# Altium project Servo-Board-v1.0.PrjPcb (part 14 of 23)

## Sheet Servo1.SchDoc
size 420 x 297 mm; SheetNumber: 7; SheetTotal: 26
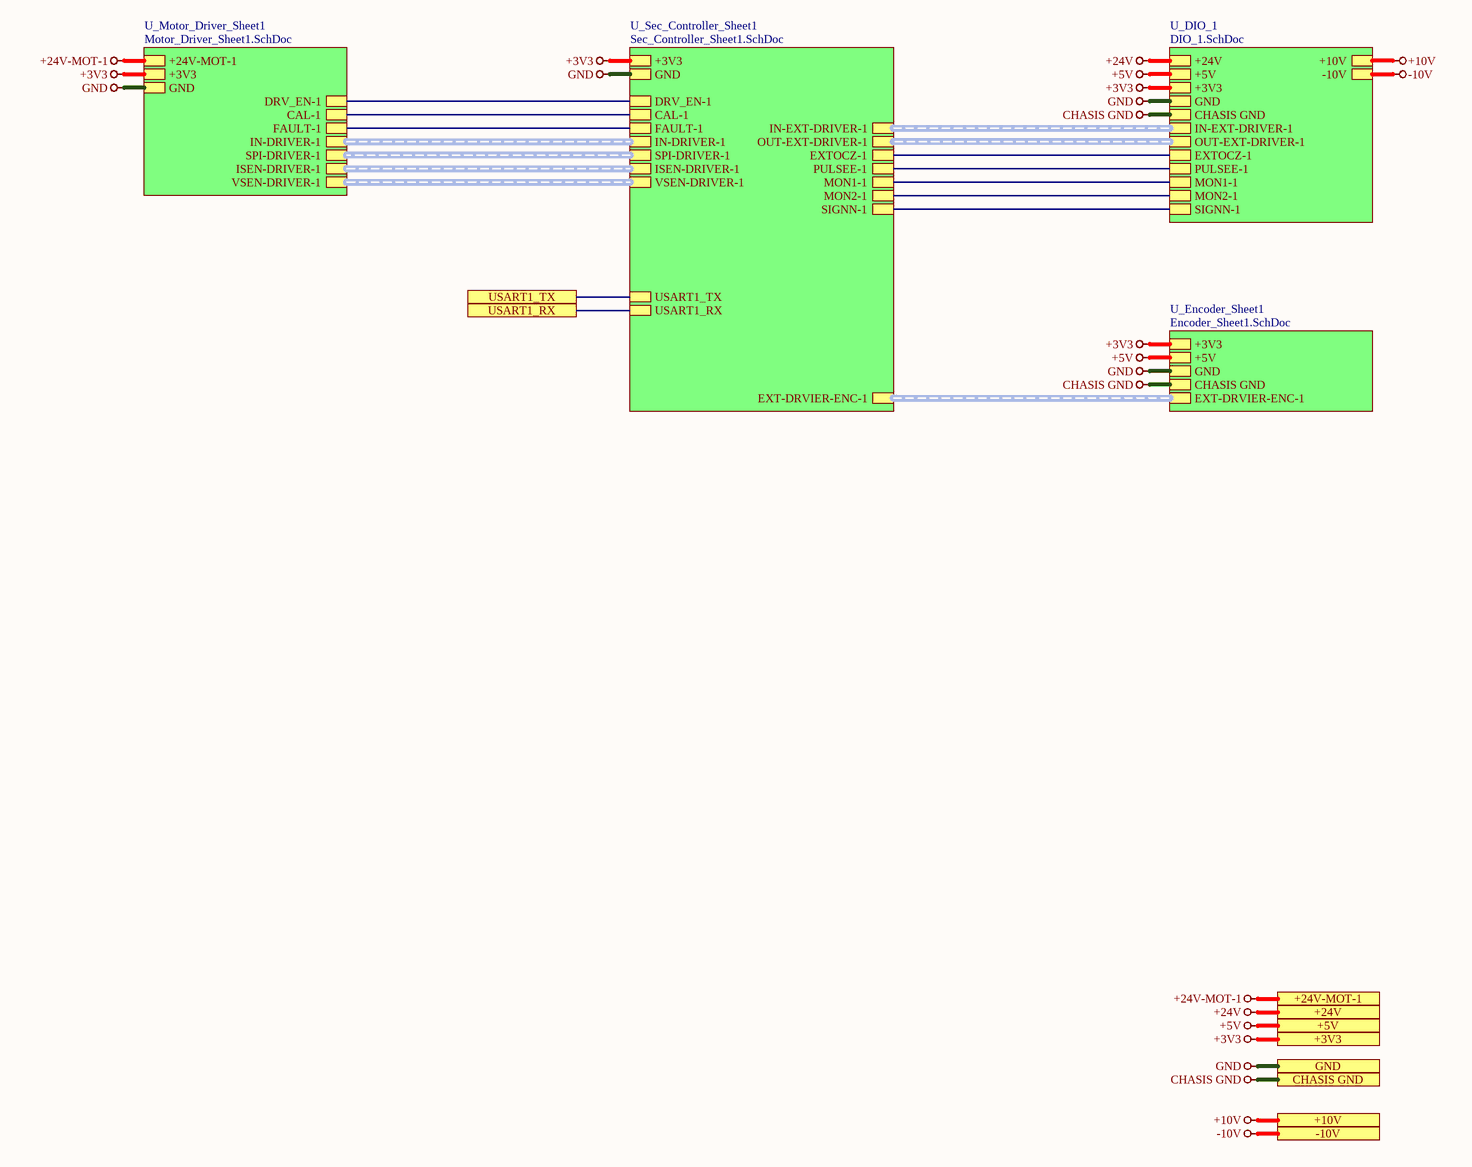
[diagram p16: Servo1.SchDoc]

### Sub-sheets
U_DIO_1 = DIO_1.SchDoc: +24V, +5V, GND, +3V3, CHASIS GND, IN-EXT-DRIVER-1 (harness IN-EXT-DRIVER-1), OUT-EXT-DRIVER-1 (harness OUT-EXT-DRIVER-1), EXTOCZ-1, PULSEE-1, MON1-1, MON2-1, SIGNN-1, +10V, -10V
U_Encoder_Sheet1 = Encoder_Sheet1.SchDoc: +3V3, +5V, GND, CHASIS GND, EXT-DRVIER-ENC-1 (harness EXT-DRVIER-ENC-1)
U_Motor_Driver_Sheet1 = Motor_Driver_Sheet1.SchDoc: +24V-MOT-1, +3V3, GND, IN-DRIVER-1 (harness IN-DRIVER-1), DRV_EN-1, CAL-1, FAULT-1, SPI-DRIVER-1 (harness SPI-DRIVER-1), ISEN-DRIVER-1 (harness ISEN-DRIVER-1), VSEN-DRIVER-1 (harness VSEN-DRIVER-1)
U_Sec_Controller_Sheet1 = Sec_Controller_Sheet1.SchDoc: +3V3, GND, IN-DRIVER-1 (harness IN-DRIVER-1), DRV_EN-1, CAL-1, FAULT-1, SPI-DRIVER-1 (harness SPI-DRIVER-1), ISEN-DRIVER-1 (harness ISEN-DRIVER-1), EXT-DRVIER-ENC-1 (harness EXT-DRVIER-ENC-1), IN-EXT-DRIVER-1 (harness IN-EXT-DRIVER-1), OUT-EXT-DRIVER-1 (harness OUT-EXT-DRIVER-1), EXTOCZ-1, PULSEE-1, MON1-1, MON2-1, SIGNN-1, USART1_TX, USART1_RX, VSEN-DRIVER-1 (harness VSEN-DRIVER-1)

### Ports
+3V3 (see Top_Sheet[5A], CAN_Sheet[4D], Controller_Sheet[5D], DIO_1[5D], DIO_2[5D], DIO_3[5D], DIO_4[5D], Encoder_Sheet1[5D], Encoder_Sheet2[4D], Encoder_Sheet3[4D], Encoder_Sheet4[5D], EtherCAT_Sheet[5D], Motor_Driver_Sheet1[5D], Motor_Driver_Sheet2[5D], Motor_Driver_Sheet3[5D], Motor_Driver_Sheet4[5D], Power_Sheet[5D], RS485_RS232_Sheet[5D], Sec_Controller_Sheet1[5D], Sec_Controller_Sheet2[5D], Sec_Controller_Sheet3[5D], Sec_Controller_Sheet4[5D], Servo2[5D], Servo3[5D], Servo4[5D]), +5V (see Top_Sheet[5A], CAN_Sheet[4D], Controller_Sheet[5D], DIO_1[5D], DIO_2[5D], DIO_3[5D], DIO_4[5D], Encoder_Sheet1[5D], Encoder_Sheet2[4D], Encoder_Sheet3[4D], Encoder_Sheet4[5D], Power_Sheet[5D], Servo2[5D], Servo3[5D], Servo4[5D]), +10V (see Top_Sheet[5A], DIO_1[5D], DIO_2[5D], DIO_3[5D], DIO_4[5D], Power_Sheet[5D], Servo2[5D], Servo3[5D], Servo4[5D]), +24V (see Top_Sheet[5A], DIO_1[5D], DIO_2[5D], DIO_3[5D], DIO_4[5D], Power_Sheet[5D], Servo2[5D], Servo3[5D], Servo4[5D]), +24V-MOT-1 (see Top_Sheet[5A], Motor_Driver_Sheet1[5D], Power_Sheet[5D]), -10V (see Top_Sheet[5A], DIO_1[5D], DIO_2[5D], DIO_3[5D], DIO_4[5D], Power_Sheet[5D], Servo2[5D], Servo3[5D], Servo4[5D]), CHASIS GND (see Top_Sheet[5A], DIO_1[5D], DIO_2[5D], DIO_3[5D], DIO_4[5D], Encoder_Sheet1[5D], Encoder_Sheet2[4D], Encoder_Sheet3[4D], Encoder_Sheet4[5D], EtherCAT_Sheet[5D], Power_Sheet[5D], Servo2[5D], Servo3[5D], Servo4[5D]), GND (see Top_Sheet[5A], CAN_Sheet[4D], Controller_Sheet[5D], DIO_1[5D], DIO_2[5D], DIO_3[5D], DIO_4[5D], Encoder_Sheet1[5D], Encoder_Sheet2[4D], Encoder_Sheet3[4D], Encoder_Sheet4[5D], EtherCAT_Sheet[5D], Motor_Driver_Sheet1[5D], Motor_Driver_Sheet2[5D], Motor_Driver_Sheet3[5D], Motor_Driver_Sheet4[5D], Power_Sheet[5D], RS485_RS232_Sheet[5D], Sec_Controller_Sheet1[5D], Sec_Controller_Sheet2[5D], Sec_Controller_Sheet3[5D], Sec_Controller_Sheet4[5D], Servo2[5D], Servo3[5D], Servo4[5D]), USART1_RX (see Top_Sheet[5A], Controller_Sheet[4D], Sec_Controller_Sheet1[5D]), USART1_TX (see Top_Sheet[5A], Controller_Sheet[4D], Sec_Controller_Sheet1[5D])

### Nets
+3V3: port +3V3, sheet U_Sec_Controller_Sheet1/+3V3, sheet U_Motor_Driver_Sheet1/+3V3, sheet U_Encoder_Sheet1/+3V3, sheet U_DIO_1/+3V3
+5V: port +5V, sheet U_Encoder_Sheet1/+5V, sheet U_DIO_1/+5V
+10V: port +10V, sheet U_DIO_1/+10V
+24V: port +24V, sheet U_DIO_1/+24V
+24V-MOT-1: port +24V-MOT-1, sheet U_Motor_Driver_Sheet1/+24V-MOT-1
-10V: port -10V, sheet U_DIO_1/-10V
CHASIS GND: port CHASIS GND, sheet U_Encoder_Sheet1/CHASIS GND, sheet U_DIO_1/CHASIS GND
GND: port GND, sheet U_Sec_Controller_Sheet1/GND, sheet U_Motor_Driver_Sheet1/GND, sheet U_Encoder_Sheet1/GND, sheet U_DIO_1/GND
CAL-1: sheet U_Sec_Controller_Sheet1/CAL-1, sheet U_Motor_Driver_Sheet1/CAL-1
DRV_EN-1: sheet U_Sec_Controller_Sheet1/DRV_EN-1, sheet U_Motor_Driver_Sheet1/DRV_EN-1
EXTOCZ-1: sheet U_Sec_Controller_Sheet1/EXTOCZ-1, sheet U_DIO_1/EXTOCZ-1
FAULT-1: sheet U_Sec_Controller_Sheet1/FAULT-1, sheet U_Motor_Driver_Sheet1/FAULT-1
MON1-1: sheet U_Sec_Controller_Sheet1/MON1-1, sheet U_DIO_1/MON1-1
MON2-1: sheet U_Sec_Controller_Sheet1/MON2-1, sheet U_DIO_1/MON2-1
PULSEE-1: sheet U_Sec_Controller_Sheet1/PULSEE-1, sheet U_DIO_1/PULSEE-1
SIGNN-1: sheet U_Sec_Controller_Sheet1/SIGNN-1, sheet U_DIO_1/SIGNN-1
USART1_RX: port USART1_RX, sheet U_Sec_Controller_Sheet1/USART1_RX
USART1_TX: port USART1_TX, sheet U_Sec_Controller_Sheet1/USART1_TX

### Buses and harness runs
harness sheet U_DIO_1/IN-EXT-DRIVER-1 = sheet U_Sec_Controller_Sheet1/IN-EXT-DRIVER-1
harness sheet U_DIO_1/OUT-EXT-DRIVER-1 = sheet U_Sec_Controller_Sheet1/OUT-EXT-DRIVER-1
harness sheet U_Encoder_Sheet1/EXT-DRVIER-ENC-1 = sheet U_Sec_Controller_Sheet1/EXT-DRVIER-ENC-1
harness sheet U_Motor_Driver_Sheet1/IN-DRIVER-1 = sheet U_Sec_Controller_Sheet1/IN-DRIVER-1
harness sheet U_Motor_Driver_Sheet1/ISEN-DRIVER-1 = sheet U_Sec_Controller_Sheet1/ISEN-DRIVER-1
harness sheet U_Motor_Driver_Sheet1/SPI-DRIVER-1 = sheet U_Sec_Controller_Sheet1/SPI-DRIVER-1
harness sheet U_Motor_Driver_Sheet1/VSEN-DRIVER-1 = sheet U_Sec_Controller_Sheet1/VSEN-DRIVER-1

### Notes on the sheet
- File:
- Title:
- Date:
- Page
- Num:
- Total:
- Drawn By: Huzaifa Ali

## Sheet Sec_Controller_Sheet1.SchDoc
size 420 x 297 mm; SheetNumber: 8; SheetTotal: 26
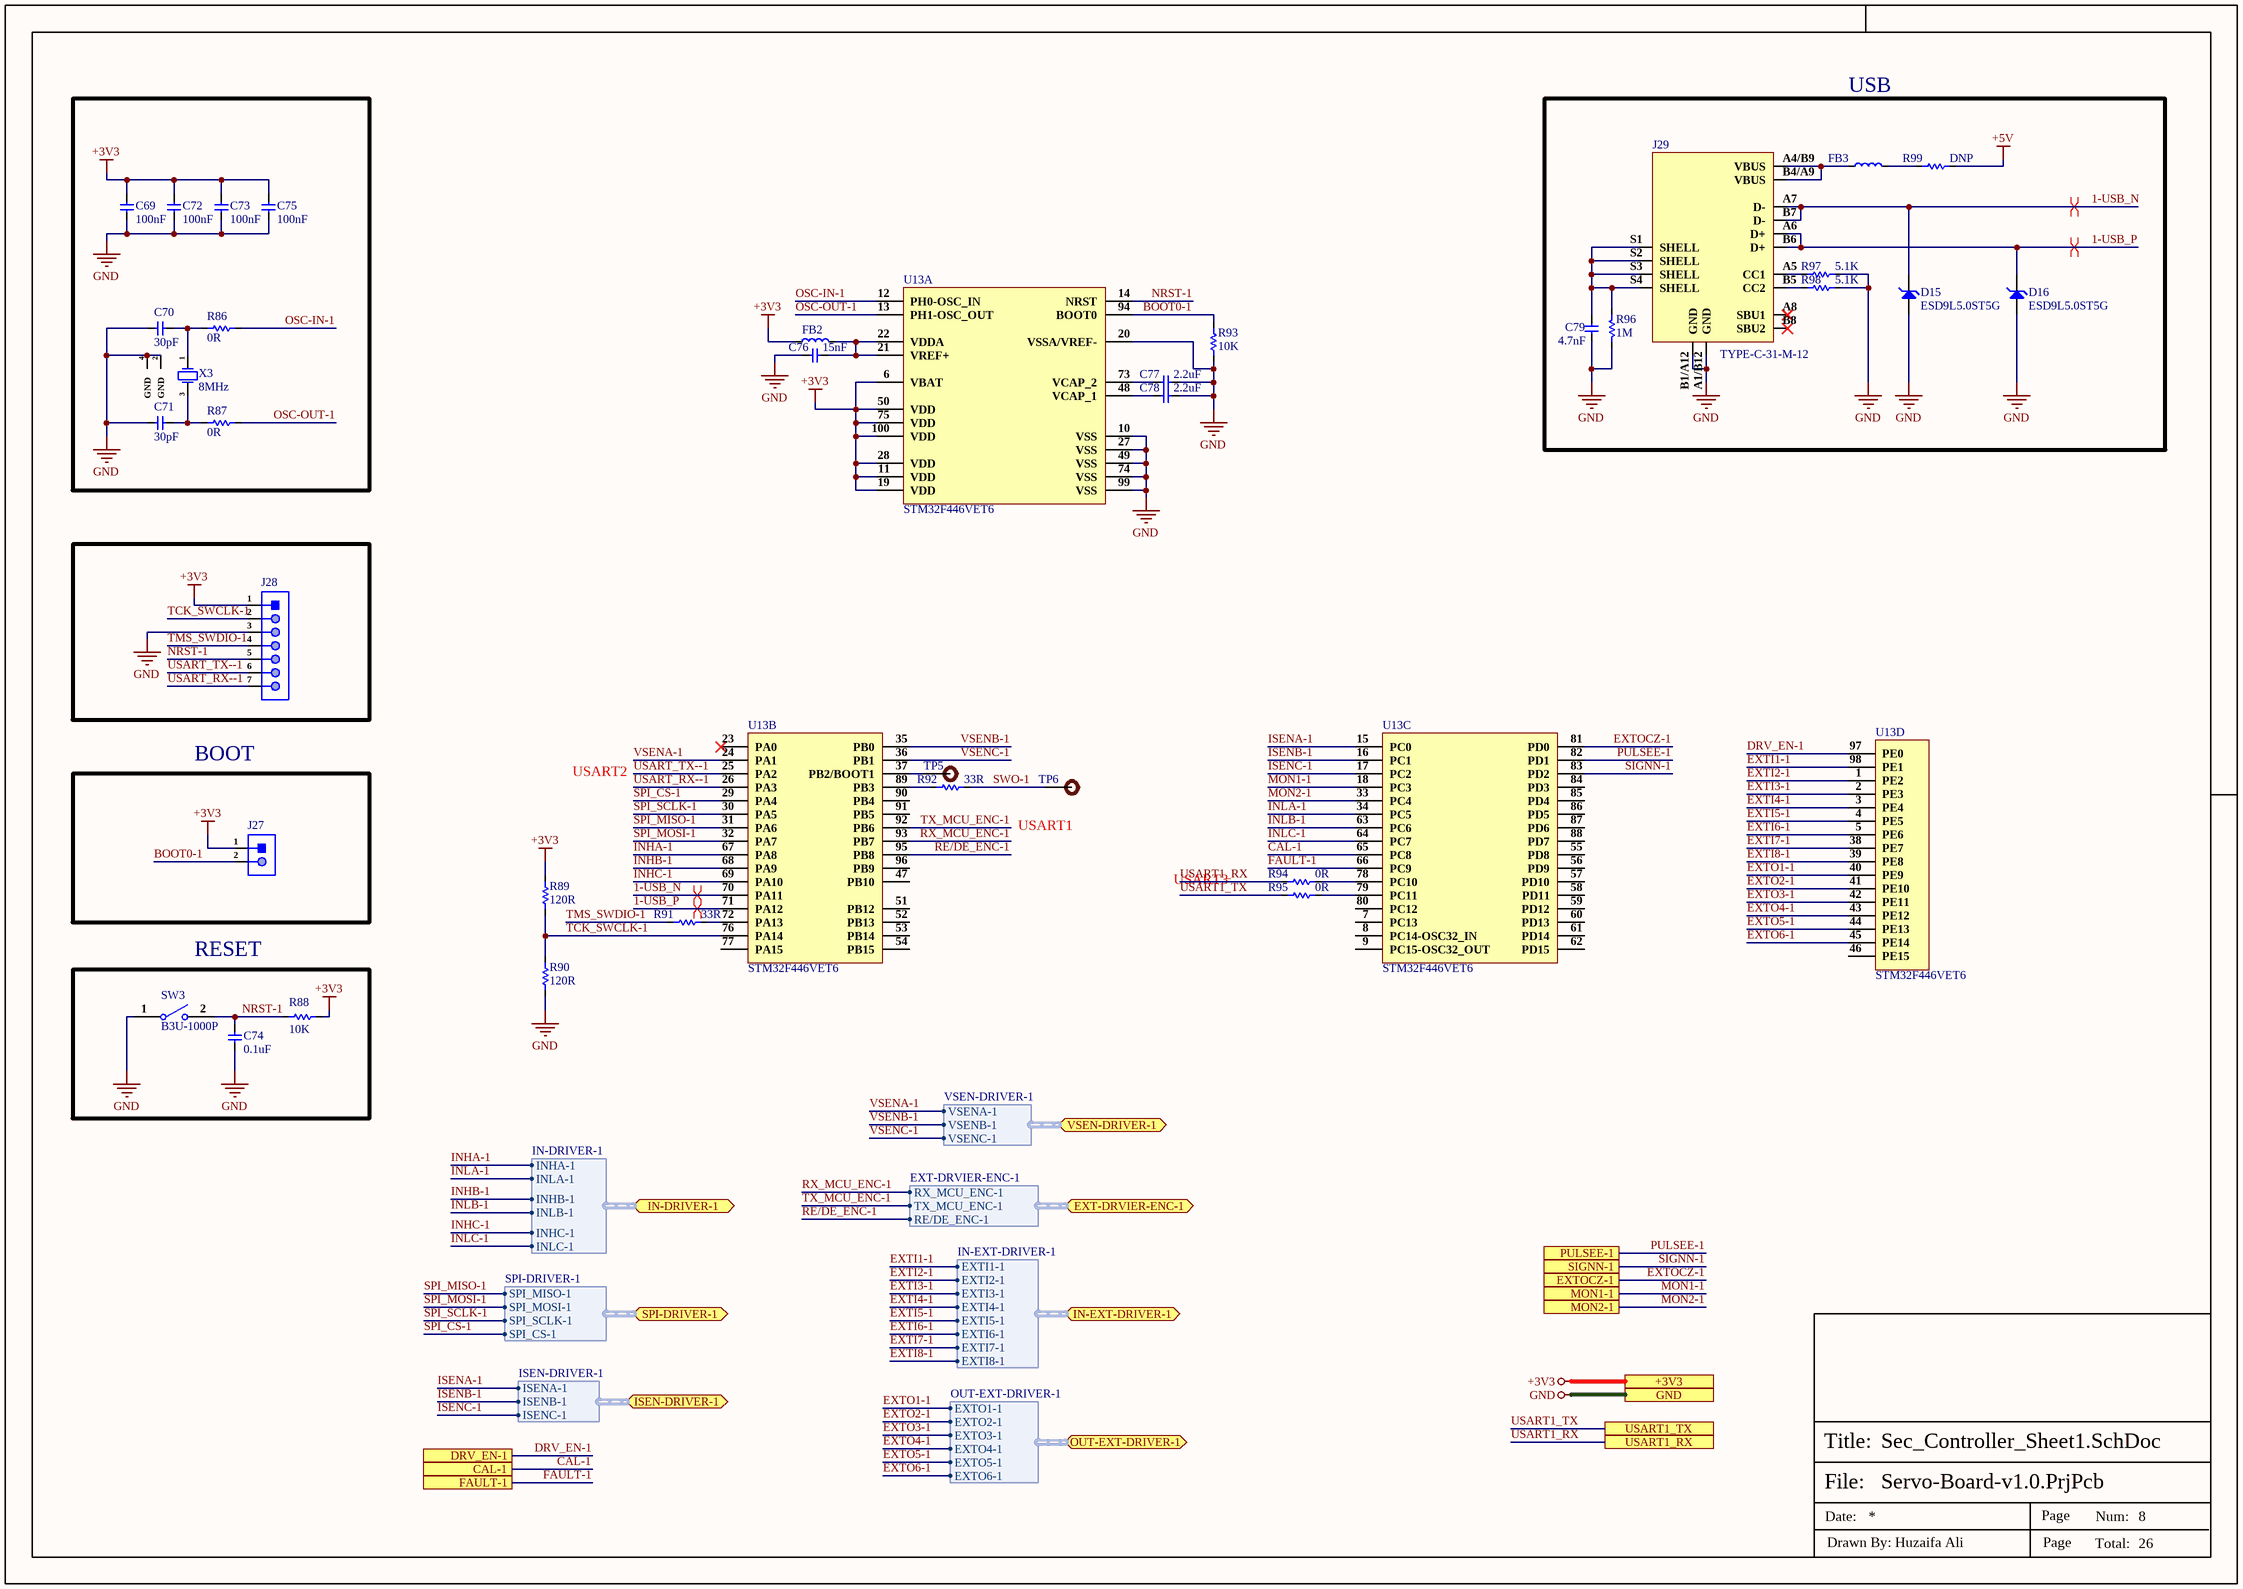
[diagram p17: Sec_Controller_Sheet1.SchDoc]

### Parts
C69  100nF  [cap-0402]
C70  30pF  [Cap-0402]
C71  30pF  [Cap-0402]
C72  100nF  [cap-0402]
C73  100nF  [cap-0402]
C74  0.1uF  [Cap-0402]
C75  100nF  [cap-0402]
C76  15nF  [Cap-0402]
C77  2.2uF  [Cap-0402]
C78  2.2uF  [Cap-0402]
C79  4.7nF  [Cap-0603]
D15  ESD9L5.0ST5G  [SOD-923.]
D16  ESD9L5.0ST5G  [SOD-923.]
FB2  BLM18PG221SN1D  [IND-0603 (1608 Metric)]  (value not drawn)
FB3  BLM18PG221SN1D  [IND-0603 (1608 Metric)]  (value not drawn)
J27  X6511WV-02H-C60D30  [HDR1X2_]  (value not drawn)
J28  X6511WV-07H-C60D30  [HDR1X7]  (value not drawn)
J29  TYPE-C-31-M-12  [TYPE-C-31-M-12_]
R86  0R  [Res-0603]
R87  0R  [Res-0603]
R88  10K  [Res-0402]
R89  120R  [Res-0402]
R90  120R  [Res-0402]
R91  33R  [Res-0402]
R92  33R  [Res-0402]
R93  10K  [Res-0402]
R94  0R  [Res-0402]
R95  0R  [Res-0402]
R96  1M  [Res-0402]
R97  5.1K  [Res-0402]
R98  5.1K  [Res-0402]
R99  DNP  [Res-0402]
SW3  B3U-1000P  [B3U-1000P]
TP5  TEST POINT 0.5mm Dia  [Test-point - 0.5mm]  (value not drawn)  (no BOM)
TP6  TEST POINT 0.5mm Dia  [Test-point - 0.5mm]  (value not drawn)  (no BOM)
U13  STM32F446VET6  [LQFP-100]  (parts A,B,C,D of 4)
X3  8MHz  [5TJ480000XYLBC_]

### Blocks framed on the sheet
USB: C79 D15 D16 FB3 J29 R96-R99
BOOT: J27
RESET: C74 R88 SW3

### Ports
+3V3 (see Servo1[3A], CAN_Sheet[4D], Controller_Sheet[5D], DIO_1[5D], DIO_2[5D], DIO_3[5D], DIO_4[5D], Encoder_Sheet1[5D], Encoder_Sheet2[4D], Encoder_Sheet3[4D], Encoder_Sheet4[5D], EtherCAT_Sheet[5D], Motor_Driver_Sheet1[5D], Motor_Driver_Sheet2[5D], Motor_Driver_Sheet3[5D], Motor_Driver_Sheet4[5D], Power_Sheet[5D], RS485_RS232_Sheet[5D], Sec_Controller_Sheet2[5D], Sec_Controller_Sheet3[5D], Sec_Controller_Sheet4[5D], Servo1[5D], Servo2[5D], Servo3[5D], Servo4[5D]), CAL-1 (see Servo1[3B], Motor_Driver_Sheet1[1D]), DRV_EN-1 (see Servo1[3B], Motor_Driver_Sheet1[1D]), EXT-DRVIER-ENC-1 (bidir, harness EXT-DRVIER-ENC-1, see Servo1[4B], Encoder_Sheet1[3D]), EXTOCZ-1 (see Servo1[4B], DIO_1[3D]), FAULT-1 (see Servo1[3B], Motor_Driver_Sheet1[1D]), GND (see Servo1[3A], CAN_Sheet[4D], Controller_Sheet[5D], DIO_1[5D], DIO_2[5D], DIO_3[5D], DIO_4[5D], Encoder_Sheet1[5D], Encoder_Sheet2[4D], Encoder_Sheet3[4D], Encoder_Sheet4[5D], EtherCAT_Sheet[5D], Motor_Driver_Sheet1[5D], Motor_Driver_Sheet2[5D], Motor_Driver_Sheet3[5D], Motor_Driver_Sheet4[5D], Power_Sheet[5D], RS485_RS232_Sheet[5D], Sec_Controller_Sheet2[5D], Sec_Controller_Sheet3[5D], Sec_Controller_Sheet4[5D], Servo1[5D], Servo2[5D], Servo3[5D], Servo4[5D]), IN-DRIVER-1 (bidir, harness IN-DRIVER-1, see Servo1[3B], Motor_Driver_Sheet1[1D]), IN-EXT-DRIVER-1 (bidir, harness IN-EXT-DRIVER-1, see Servo1[4B], DIO_1[1D]), ISEN-DRIVER-1 (bidir, harness ISEN-DRIVER-1, see Servo1[3B], Motor_Driver_Sheet1[3D]), MON1-1 (see Servo1[4B], DIO_1[3D]), MON2-1 (see Servo1[4B], DIO_1[3D]), OUT-EXT-DRIVER-1 (bidir, harness OUT-EXT-DRIVER-1, see Servo1[4B], DIO_1[2D]), PULSEE-1 (see Servo1[4B], DIO_1[3D]), SIGNN-1 (see Servo1[4B], DIO_1[3D]), SPI-DRIVER-1 (bidir, harness SPI-DRIVER-1, see Servo1[3B], Motor_Driver_Sheet1[2D]), USART1_RX (see Servo1[3B], Controller_Sheet[4D], Servo1[3B]), USART1_TX (see Servo1[3B], Controller_Sheet[4D], Servo1[3B]), VSEN-DRIVER-1 (bidir, harness VSEN-DRIVER-1, see Servo1[3B], Motor_Driver_Sheet1[4D])

### Harnesses
IN-DRIVER-1: INHA-1, INLA-1, INHB-1, INLB-1, INHC-1, INLC-1
SPI-DRIVER-1: SPI_MISO-1, SPI_MOSI-1, SPI_SCLK-1, SPI_CS-1
ISEN-DRIVER-1: ISENA-1, ISENB-1, ISENC-1
EXT-DRVIER-ENC-1: RX_MCU_ENC-1, TX_MCU_ENC-1, RE/DE_ENC-1
IN-EXT-DRIVER-1: EXTI1-1, EXTI2-1, EXTI3-1, EXTI4-1, EXTI5-1, EXTI6-1, EXTI7-1, EXTI8-1
OUT-EXT-DRIVER-1: EXTO1-1, EXTO2-1, EXTO3-1, EXTO4-1, EXTO5-1, EXTO6-1
VSEN-DRIVER-1: VSENA-1, VSENB-1, VSENC-1

### Nets
+3V3: C69.2 C72.2 C73.2 C75.2 FB2.1 J27.1 J28.1 R88.2 R89.2 U13.6(VBAT) U13.11(VDD) U13.19(VDD) U13.28(VDD) U13.50(VDD) U13.75(VDD) U13.100(VDD) ; port +3V3
+5V: R99.2
GND: C69.1 C70.1 C71.1 C72.1 C73.1 C74.1 C75.1 C76.1 C77.2 C78.2 C79.1 D15.2(A) D16.2(A) J28.3 J29.A1/B12(GND) J29.B1/A12(GND) R90.1 R93.1 R96.2 R97.2 R98.2 SW3.1 U13.10(VSS) U13.20(VSSA/VREF-) U13.27(VSS) U13.49(VSS) U13.74(VSS) U13.99(VSS) X3.2(GND) X3.4(GND) ; port GND
1-USB_N: D15.1(K) J29.A7(D-) J29.B7(D-) U13.70(PA11)
1-USB_P: D16.1(K) J29.A6(D+) J29.B6(D+) U13.71(PA12)
BOOT0-1: J27.2 R93.2 U13.94(BOOT0)
CAL-1: U13.65(PC8) ; port CAL-1
DRV_EN-1: U13.97(PE0) ; port DRV_EN-1
EXTI1-1: U13.98(PE1) ; port IN-EXT-DRIVER-1.EXTI1-1
EXTI2-1: U13.1(PE2) ; port IN-EXT-DRIVER-1.EXTI2-1
EXTI3-1: U13.2(PE3) ; port IN-EXT-DRIVER-1.EXTI3-1
EXTI4-1: U13.3(PE4) ; port IN-EXT-DRIVER-1.EXTI4-1
EXTI5-1: U13.4(PE5) ; port IN-EXT-DRIVER-1.EXTI5-1
EXTI6-1: U13.5(PE6) ; port IN-EXT-DRIVER-1.EXTI6-1
EXTI7-1: U13.38(PE7) ; port IN-EXT-DRIVER-1.EXTI7-1
EXTI8-1: U13.39(PE8) ; port IN-EXT-DRIVER-1.EXTI8-1
EXTO1-1: U13.40(PE9) ; port OUT-EXT-DRIVER-1.EXTO1-1
EXTO2-1: U13.41(PE10) ; port OUT-EXT-DRIVER-1.EXTO2-1
EXTO3-1: U13.42(PE11) ; port OUT-EXT-DRIVER-1.EXTO3-1
EXTO4-1: U13.43(PE12) ; port OUT-EXT-DRIVER-1.EXTO4-1
EXTO5-1: U13.44(PE13) ; port OUT-EXT-DRIVER-1.EXTO5-1
EXTO6-1: U13.45(PE14) ; port OUT-EXT-DRIVER-1.EXTO6-1
EXTOCZ-1: U13.81(PD0) ; port EXTOCZ-1
FAULT-1: U13.66(PC9) ; port FAULT-1
INHA-1: U13.67(PA8) ; port IN-DRIVER-1.INHA-1
INHB-1: U13.68(PA9) ; port IN-DRIVER-1.INHB-1
INHC-1: U13.69(PA10) ; port IN-DRIVER-1.INHC-1
INLA-1: U13.34(PC5) ; port IN-DRIVER-1.INLA-1
INLB-1: U13.63(PC6) ; port IN-DRIVER-1.INLB-1
INLC-1: U13.64(PC7) ; port IN-DRIVER-1.INLC-1
ISENA-1: U13.15(PC0) ; port ISEN-DRIVER-1.ISENA-1
ISENB-1: U13.16(PC1) ; port ISEN-DRIVER-1.ISENB-1
ISENC-1: U13.17(PC2) ; port ISEN-DRIVER-1.ISENC-1
MON1-1: U13.18(PC3) ; port MON1-1
MON2-1: U13.33(PC4) ; port MON2-1
NRST-1: C74.2 J28.5 R88.1 SW3.2 U13.14(NRST)
OSC-IN-1: R86.2 U13.12(PH0-OSC_IN)
OSC-OUT-1: R87.2 U13.13(PH1-OSC_OUT)
PULSEE-1: U13.82(PD1) ; port PULSEE-1
RE/DE_ENC-1: U13.95(PB8) ; port EXT-DRVIER-ENC-1.RE/DE_ENC-1
RX_MCU_ENC-1: U13.93(PB7) ; port EXT-DRVIER-ENC-1.RX_MCU_ENC-1
SIGNN-1: U13.83(PD2) ; port SIGNN-1
SPI_CS-1: U13.29(PA4) ; port SPI-DRIVER-1.SPI_CS-1
SPI_MISO-1: U13.31(PA6) ; port SPI-DRIVER-1.SPI_MISO-1
SPI_MOSI-1: U13.32(PA7) ; port SPI-DRIVER-1.SPI_MOSI-1
SPI_SCLK-1: U13.30(PA5) ; port SPI-DRIVER-1.SPI_SCLK-1
SWO-1: R92.2 TP6.1
TCK_SWCLK-1: J28.2 R89.1 R90.2 U13.76(PA14)
TMS_SWDIO-1: J28.4 R91.1
TX_MCU_ENC-1: U13.92(PB6) ; port EXT-DRVIER-ENC-1.TX_MCU_ENC-1
USART1_RX: R94.1 ; port USART1_RX
USART1_TX: R95.1 ; port USART1_TX
USART_RX--1: J28.7 U13.26(PA3)
USART_TX--1: J28.6 U13.25(PA2)
VSENA-1: U13.24(PA1) ; port VSEN-DRIVER-1.VSENA-1
VSENB-1: U13.35(PB0) ; port VSEN-DRIVER-1.VSENB-1
VSENC-1: U13.36(PB1) ; port VSEN-DRIVER-1.VSENC-1
NetC70_2: C70.2 R86.1 X3.1(OSC1)
NetC71_2: C71.2 R87.1 X3.3(OSC2)
NetC76_2: C76.2 FB2.2 U13.21(VREF+) U13.22(VDDA)
NetC77_1: C77.1 U13.73(VCAP_2)
NetC78_1: C78.1 U13.48(VCAP_1)
NetC79_2: C79.2 J29.S1(SHELL) J29.S2(SHELL) J29.S3(SHELL) J29.S4(SHELL) R96.1
NetFB3_1: FB3.1 J29.A4/B9(VBUS) J29.B4/A9(VBUS)
NetFB3_2: FB3.2 R99.1
NetJ29_A5: J29.A5(CC1) R97.1
NetJ29_B5: J29.B5(CC2) R98.1
NetR91_2: R91.2 U13.72(PA13)
NetR92_1: R92.1 U13.89(PB3)
NetR94_2: R94.2 U13.78(PC10)
NetR95_2: R95.2 U13.79(PC11)
NetTP5_1: TP5.1 U13.37(PB2/BOOT1)

Not connected (* = marked no-connect by the designer): J29 A8(SBU1)* B8(SBU2)*; U13 7(PC13) 8(PC14-OSC32_IN) 9(PC15-OSC32_OUT) 23(PA0)* 46(PE15) 47(PB10) 51(PB12) 52(PB13) 53(PB14) 54(PB15) 55(PD8) 56(PD9) 57(PD10) 58(PD11) 59(PD12) 60(PD13) 61(PD14) 62(PD15) 77(PA15) 80(PC12) 84(PD3) 85(PD4) 86(PD5) 87(PD6) 88(PD7) 90(PB4) 91(PB5) 96(PB9)

### Layout directives
differential pair; net class USB_PROGRAM; differential pair class USB_PROGRAM_LINES; rule Impedance Constraint [Min = 85.00    Max = 90.00    ]; rule Matched Net Lengths [Tolerance = 50mil]: 1-USB_N, 1-USB_P

### Notes on the sheet
- USART2
- (near TP6) USART1
- USART3
- File:
- Title:
- Date:
- Page
- Num:
- Total:
- Drawn By: Huzaifa Ali

### Library data of the parts
C69 C72 C73 C75 = C1005X7R1H104KT000F: CAP CER 0.1UF 50V X7R 0402; Manufacturer: TDK; Tolerance: 10%; Voltage: 25V; Item Type: Capacitor; Supplier 1: Avnet; Manufacturer Part Number: C1005X7R1H104KT000F; RoHS: No; Category: Ceramic Capacitors; Dielectric: X7R; Supplier Part Number 1: C1005X7R1H104KT000F; LCSC Part Number: C361198; ComponentLink1Description: LCSC; ComponentLink1URL: https://www.lcsc.com/product-detail/Multilayer-Ceramic-Capacitors-MLCC-SMD-SMT_TDK-C1005X7R1H104KT000F_C361198.html
C70 C71 = CC0402GRNPO9BN300: CAP CER 30PF 50V C0G/NPO 0402; Manufacturer: Yageo; Item Type: Capacitor; Tolerance: 2%; Dielectric: C0G; Supplier: Digikey; LCSC Part Number: C277479; Manufacturer Part Number: CC0402GRNPO9BN300; RoHS: Yes; Stock: 114930; Pricing: 1=0.1, 10=0.052, 50=0.0296, 100=0.023, 500=0.01728, 1000=0.01358, 2500=0.01235, 5000=0.01136 (USD); Mounting Technology: Surface Mount; Case/Package: 0402; Case Code (Imperial): 0402; Case Code (Metric): 1005; Weight: 2.3E-05oz; Min Operating Temperature: -55°C; Max Operating Temperature: 125°C; Value: 30pF; Voltage Rating (DC): 50V; Packaging: Tape and Reel; Termination: SMD/SMT; Voltage Rating: 50V; Series: CC; Length: 0.039inch; Width: 0.02inch; Thickness: 0.022inch; Halogen Free: 5694HalogenFree; Lead Free: 5697LeadFree; ComponentLink1URL: https://datasheet.ciiva.com/13263/upy-gp-np0-16v-to-50v-8-3714-13263350.pdf?src-supplier=Mouser; ComponentLink1Description: https://datasheet.ciiva.com/13263/upy-gp-np0-16v-to-50v-8-3714-13263350.pdf?src-supplier=Mouser
C74 = CC0402JRX7R7BB104: CAP CER 0.1UF 16V X7R 0402; Manufacturer: Yageo; Material: 4241ConductorMaterial; Value: 100nF; Tolerance: 5%; Item Type: Capacitor; Supplier: Digikey; Supplier Part Number: 311-1676-1-ND; Manufacturer Part Number: CC0402JRX7R7BB104; RoHS: Yes; Category: Ceramic Capacitors; Stock: 1659111; Pricing: 1=0.1, 10=0.046, 50=0.0262, 100=0.0203, 500=0.01528, 1000=0.012, 2500=0.01091, 5000=0.01004 (USD); Mounting Technology: Surface Mount; Case/Package: 0402; Case Code (Metric): 1005; Case Code (Imperial): 0402; Min Operating Temperature: -55°C; Max Operating Temperature: 125°C; Dielectric: X7R; Packaging: Tape and Reel; Package Quantity: 10000; Voltage Rating (DC): 16V; Voltage Rating: 16V; Series: CC; Construction: Flat; Length: 0.039inch; Width: 0.02inch; Height: 0.5mm; Thickness: 0.022inch; Lead Free: Lead Free; Halogen Free: Halogen Free; RoHS Compliant: Yes; ComponentLink1URL: https://datasheet.ciiva.com/13210/upy-gphc-x7r-6-3v-to-50v-8-12304-13210152.pdf?src-supplier=Mouser; ComponentLink1Description: https://datasheet.ciiva.com/13210/upy-gphc-x7r-6-3v-to-50v-8-12304-13210152.pdf?src-supplier=Mouser; LCSC Part Number: C541464
C76 = CC0402JRX7R7BB153: CAP CER 0.015UF 16V X7R 0402; Manufacturer: Yageo; Tolerance: 5%; Item Type: Capacitor; Supplier: Digikey; Supplier Part Number: 13-CC0402JRX7R7BB153CT-ND; Manufacturer Part Number: CC0402JRX7R7BB153; RoHS: Yes; Category: Ceramic Capacitors; Stock: 24539; Pricing: 1=0.1, 10=0.045, 50=0.0258, 100=0.0201, 500=0.0151, 1000=0.01186, 2500=0.01078, 5000=0.00992 (USD); Mounting Technology: Surface Mount; Case/Package: 0402; Case Code (Imperial): 0402; Case Code (Metric): 1005; Weight: 2.3E-05oz; Min Operating Temperature: -55°C; Max Operating Temperature: 125°C; Value: 15nF; Voltage Rating (DC): 16V; Packaging: Tape and Reel; Dielectric: X7R; Voltage Rating: 16V; Termination: SMD/SMT; Series: CC; Length: 0.039inch; Width: 0.02inch; Thickness: 0.022inch; Lead Free: Lead Free; Halogen Free: Halogen Free; RoHS Compliant: Yes; ComponentLink1URL: https://datasheet.ciiva.com/13263/upy-gphc-x7r-6-3v-to-50v-8-12304-13263342.pdf?src-supplier=Mouser; ComponentLink1Description: https://datasheet.ciiva.com/13263/upy-gphc-x7r-6-3v-to-50v-8-12304-13263342.pdf?src-supplier=Mouser; LCSC Part Number: C527002
C77 C78 = C1005X5R0J225KTJA0E: CAP CER 2.2UF 6.3V X5R 0402; Manufacturer: TDK; Item Type: Capacitor; LCSC Part Number: C343036; Manufacturer Part Number: C1005X5R0J225KTJA0E; ComponentLink1Description: LCSC; ComponentLink1URL: https://www.lcsc.com/product-detail/Multilayer-Ceramic-Capacitors-MLCC-SMD-SMT_TDK-C1005X5R0J225KTJA0E_C343036.html
C79 = CC0603JRNPO9BN472: CAP CER 4700PF 50V C0G/NPO 0603; Manufacturer: Yageo; Item Type: Capacitor; Supplier 1: Digi-Key; Manufacturer Part Number: CC0603JRNPO9BN472; RoHS: Yes; Category: Ceramic Capacitors; Stock 1: 31779; Pricing 1: 1=0.48000, 10=0.33000, 50=0.23100, 100=0.19800, 500=0.14854, 1000=0.12543 (USD); RoHS Compliant: Yes; Supplier Part Number 1: 13-CC0603JRNPO9BN472CT-ND; LCSC Part Number: C576818; ComponentLink1Description: LCSC; ComponentLink1URL: https://www.lcsc.com/product-detail/Multilayer-Ceramic-Capacitors-MLCC-SMD-SMT_YAGEO-CC0603JRNPO9BN472_C576818.html
D15 D16 = ESD9L5.0ST5G: TVS DIODE 5V 9.8V SOD923; Manufacturer: ON Semiconductor; Capacitance: 0.9pF; Direction: Unidirectional; Number of Unidirectional Channels: 1; Min Breakdown Voltage: 5.4V; Power Line Protection: No; Leakage Current: 1uA; Element Configuration: Single; Peak Pulse Current: 1A; Diode Type: ZENER; Reverse Breakdown Voltage: 5.8V; Peak Pulse Power: 150mW; ESD Protection: Yes; Test Current: 1mA; Supplier 1: Digi-Key; Manufacturer Part Number: ESD9L5.0ST5G; RoHS: Yes; Category: ESD and Circuit Protection ICs; Stock 1: 558996; Pricing 1: 1=0.37000, 10=0.25600, 100=0.12500, 500=0.10426, 1000=0.07244, 2000=0.06278 (USD); Case/Package: SOD-923-2; Number of Pins: 2; Contact Plating: Tin,Matte; Min Operating Temperature: -55°C; Max Operating Temperature: 150°C; Package Quantity: 1; Packaging: Tape and Reel; Clamping Voltage: 9.8V; Reverse Standoff Voltage: 5V; Working Voltage: 5V; Resistor Type: Zener; Series: Automotive, AEC-Q101; Number of Elements: 1; Operating Supply Voltage: 5V; Max Surge Current: 1A; Breakdown Voltage: 5.4V; Number of Channels: 1; Polarity: Unidirectional; Termination: SMD/SMT; Max Reverse Leakage Current: 1uA; Max Breakdown Voltage: 5.4V; Number of Lines: 1; Power Dissipation: 150mW; Clamping Voltage-Max: 9.8V; Length: 0.8mm; Width: 0.65mm; Height: 0.4mm; Depth: 0.6mm; Radiation Hardening: No; Lead Free: Lead Free; RoHS Compliant: Yes; REACH SVHC: No SVHC; Halogen Free: Halogen Free; ComponentLink1URL: https://datasheet.ciiva.com/15143/getdatasheetpartid-185186-15143896.pdf?src-supplier=Verical; ComponentLink1Description: https://datasheet.ciiva.com/15143/getdatasheetpartid-185186-15143896.pdf?src-supplier=Verical; ComponentLink2URL: https://datasheet.ciiva.com/4510/esd9l-d-4510647.pdf?src-supplier=Mouser; ComponentLink2Description: https://datasheet.ciiva.com/4510/esd9l-d-4510647.pdf?src-supplier=Mouser; ComponentLink3URL: https://datasheet.ciiva.com/3304/esd9l-d-3304011.pdf?src-supplier=Avnet; ComponentLink3Description: https://datasheet.ciiva.com/3304/esd9l-d-3304011.pdf?src-supplier=Avnet; ComponentLink4URL: https://datasheet.ciiva.com/16437/esd9l-d-16437835.pdf?src-supplier=Future+Electronics; ComponentLink4Description: https://datasheet.ciiva.com/16437/esd9l-d-16437835.pdf?src-supplier=Future+Electronics; ComponentLink5URL: https://datasheet.ciiva.com/339/esd9l-d-339853.pdf?src-supplier=Digi-Key; ComponentLink5Description: https://datasheet.ciiva.com/339/esd9l-d-339853.pdf?src-supplier=Digi-Key; ComponentLink6URL: https://datasheet.ciiva.com/339/esd9l-d-339854.pdf?src-supplier=Digi-Key; ComponentLink6Description: https://datasheet.ciiva.com/339/esd9l-d-339854.pdf?src-supplier=Digi-Key; ComponentLink7URL: https://datasheet.ciiva.com/11195/esd9l-d-11195342.pdf?src-supplier=Avnet; ComponentLink7Description: https://datasheet.ciiva.com/11195/esd9l-d-11195342.pdf?src-supplier=Avnet; ComponentLink8URL: https://datasheet.ciiva.com/25958/esd9l-d-25958446.pdf?src-supplier=Avnet+Europe; ComponentLink8Description: https://datasheet.ciiva.com/25958/esd9l-d-25958446.pdf?src-supplier=Avnet+Europe; ComponentLink9URL: https://datasheet.ciiva.com/339/esd9l-d-339855.pdf?src-supplier=Digi-Key; ComponentLink9Description: https://datasheet.ciiva.com/339/esd9l-d-339855.pdf?src-supplier=Digi-Key; Supplier Part Number 1: ESD9L5.0ST5GOSCT-ND; LCSC Part Number: C82326
FB2 FB3 = BLM18PG221SN1D: FERRITE BEAD 220 OHM 0603 1LN; Manufacturer: Murata; Manufacturer Series: BLM18P; Material: Steel,Ferrite; Value: 100mR; Impedance: 220R; Tolerance: 25%; Current Rating: 1.4A; Number of Lines: 1; Test Frequency: 100MHz; Shielding: Unshielded; Supplier: Digikey; LCSC Part Number: C80165; Manufacturer Part Number: BLM18PG221SN1D; RoHS: Yes; Item Type: Ferrite Bead; Stock: 134052; Pricing: 1=0.1, 10=0.078, 25=0.0712, 50=0.064, 100=0.0469, 250=0.03412, 500=0.03128, 1000=0.02701 (USD); Case/Package: 0603; Pins: 2; Core Material: Ferrite; Case Code (Metric): 1608; Case Code (Imperial): 0603; Weight: 7.1E-05oz; Min Operating Temperature: -55°C; Max Operating Temperature: 125°C; Package Quantity: 1; Packaging: Tape and Reel; ESR (Equivalent Series Resistance): 220R; Max Current Rating: 1.4A; DC Resistance (DCR): 100mR; Termination: SMD/SMT; Max DC Current: 1.4A; DC Current: 1.4A; Number of Circuits: 1; Series: BLM18P; Channels: 1; DC Resistance-Max: 100mR; RMS Current (Irms): 1.4A; ESR: 100mR; Length: 1.6mm; Width: 0.8mm; Height: 0.8mm; Depth: 0.8mm; Radiation Hardening: No; Reach SVHC Compliant: No; Lead Free: Lead Free; RoHS Compliant: Yes; ComponentLink1URL: https://datasheet.ciiva.com/19458/1845030-19458417.pdf?src-supplier=Jameco; ComponentLink1Description: https://datasheet.ciiva.com/19458/1845030-19458417.pdf?src-supplier=Jameco; ComponentLink2URL: https://datasheet.ciiva.com/11800/0900766b81275ca5-11800851.pdf?src-supplier=Rs; ComponentLink2Description: https://datasheet.ciiva.com/11800/0900766b81275ca5-11800851.pdf?src-supplier=Rs; ComponentLink3URL: https://datasheet.ciiva.com/29347/442391-da-01-en-chip-drossel-0603-220r-1400ma-1-6x0-8mm-29347986.pdf?src-supplier=Conrad; ComponentLink3Description: https://datasheet.ciiva.com/29347/442391-da-01-en-chip-drossel-0603-220r-1400ma-1-6x0-8mm-29347986.pdf?src-supplier=Conrad; ComponentLink4URL: https://datasheet.ciiva.com/8021/5148-8021482.pdf?src-supplier=Element14; ComponentLink4Description: https://datasheet.ciiva.com/8021/5148-8021482.pdf?src-supplier=Element14; ComponentLink5URL: https://datasheet.ciiva.com/8021/5148-8021479.pdf?src-supplier=Element14; ComponentLink5Description: https://datasheet.ciiva.com/8021/5148-8021479.pdf?src-supplier=Element14; ComponentLink6URL: https://datasheet.ciiva.com/14122/blm-series-eng-tds-14122909.pdf?src-supplier=Distrelec; ComponentLink6Description: https://datasheet.ciiva.com/14122/blm-series-eng-tds-14122909.pdf?src-supplier=Distrelec; ComponentLink7URL: https://datasheet.ciiva.com/1012/l0110s0100blm18p-1012162.pdf?src-supplier=Digikey; ComponentLink7Description: https://datasheet.ciiva.com/1012/l0110s0100blm18p-1012162.pdf?src-supplier=Digikey; ComponentLink8URL: https://datasheet.ciiva.com/1012/l0110s0100blm18p-1012161.pdf?src-supplier=Digikey; ComponentLink8Description: https://datasheet.ciiva.com/1012/l0110s0100blm18p-1012161.pdf?src-supplier=Digikey; ComponentLink9URL: https://datasheet.ciiva.com/1012/l0110s0100blm18p-1012163.pdf?src-supplier=Digikey; ComponentLink9Description: https://datasheet.ciiva.com/1012/l0110s0100blm18p-1012163.pdf?src-supplier=Digikey; ComponentLink10URL: https://datasheet.ciiva.com/3081/l0110s0100blm18p-3081633.pdf?src-supplier=Avnet; ComponentLink10Description: https://datasheet.ciiva.com/3081/l0110s0100blm18p-3081633.pdf?src-supplier=Avnet; ComponentLink11URL: https://datasheet.ciiva.com/16205/l0110s0100blm18p-16205422.pdf?src-supplier=Future+Electronics; ComponentLink11Description: https://datasheet.ciiva.com/16205/l0110s0100blm18p-16205422.pdf?src-supplier=Future+Electronics
J27 = X6511WV-02H-C60D30: Gold 250V 3A Straight Square Pins 2.5mm 2P 260℃ 6mm -40℃~+105℃ 3mm 2.54mm Plugin Black Brass 1x2P Plugin,P=2.54mm Pin Headers ROHS; Manufacturer: XKB; Item Type: Male Header; Manufacturer Part Number: X6511WV-02H-C60D30; Package: Plugin,P=2.54mm; LCSC Part Number: C706874; ComponentLink1Description: LCSC; ComponentLink1URL: https://www.lcsc.com/product-detail/Pin-Headers_XKB-Connectivity-X6511WV-02H-C60D30_C706874.html
J28 = X6511WV-07H-C60D30: Gold 250V 3A Straight Square Pins 2.5mm 7P 260℃ 6mm -40℃~+105℃ 3mm 2.54mm Plugin Black Brass 1x7P Plugin,P=2.54mm Pin Headers ROHS; Manufacturer: XKB; Item Type: Male Header; Manufacturer Part Number: X6511WV-07H-C60D30; Package: Plugin,P=2.54mm; LCSC Part Number: C706879; ComponentLink1Description: LCSC; ComponentLink1URL: https://www.lcsc.com/product-detail/Pin-Headers_XKB-Connectivity-X6511WV-07H-C60D30_C706879.html
J29 = TYPE-C-31-M-12: 5A 1 16P Female Type-C SMD USB Connectors ROHS; Manufacturer: Korean Hroparts Elec; ComponentLink1Description: LCSC; ComponentLink1URL: https://www.lcsc.com/product-detail/USB-Connectors_Korean-Hroparts-Elec-TYPE-C-31-M-12_C165948.html; Manufacturer Part Number: TYPE-C-31-M-12; Footprint: Custom; LCSC Part Number: C165948; Item Type: USB Connector
R86 R87 = RC0603JR-070RL: RES 0 OHM JUMPER 1/10W 0603; Manufacturer: Yageo; Resistance: 0mR; Tolerance: 1%; Power Rating: 100mW; Voltage Rating (DC): 50V; Temperature Coefficient: 200ppm/°C; Resistance Tolerance: 5%; Item Type: Resistor; Supplier 1: Digi-Key; Manufacturer Part Number: RC0603JR-070RL; RoHS: Yes; Category: Chip SMD Resistors; Stock 1: 18081776; Pricing 1: 1=0.10000, 10=0.01700, 25=0.01240, 50=0.00960, 100=0.00700, 250=0.00536, 500=0.00430, 1000=0.00316 (USD); Case/Package: 0603; Number of Pins: 2; Contact Plating: Tin,Matte; Case Code (Imperial): 0603; Case Code (Metric): 1608; Size Code: 0603; Min Operating Temperature: -55°C; Max Operating Temperature: 155°C; Resistor Type: Thick Film; Packaging: Tape and Reel; Termination: SMD/SMT; Series: RC; Technology: THICK FILM; Package Quantity: 5000; Voltage Rating: 50V; Features: Moisture Resistant; Max Power Dissipation: 100mW; Number of Terminations: 2; Construction: Rectangular; Length: 1.6mm; Width: 0.8mm; Height: 0.45mm; Depth: 0.8mm; Radiation Hardening: No; Reach SVHC Compliant: No SVHC; Lead Free: Lead Free; RoHS Compliant: Yes; Military Standard: Not; Supplier Part Number 1: 311-0.0GRCT-ND; LCSC Part Number: C95177
R88 R93 = RC0402FR-0710KL: RES 10K OHM 1% 1/16W 0402; Manufacturer: Yageo; Resistance: 10kR; Voltage Rating (DC): 50V; Temperature Coefficient: 100ppm/°C; Power Rating: 62.5mW; Max Power Dissipation: 63mW; Item Type: Resistor; Supplier 1: Mouser; Manufacturer Part Number: RC0402FR-0710KL; RoHS: Yes; Category: Chip SMD Resistors; Stock 1: 18648329; Pricing 1: 1=0.10000, 10=0.01400, 50=0.01400, 100=0.00500, 1000=0.00300, 10000=0.00200 (USD); Case/Package: 0402; Number of Pins: 2; Case Code (Imperial): 0402; Case Code (Metric): 1005; Min Operating Temperature: -55°C; Max Operating Temperature: 155°C; Resistor Type: Thick Film; Tolerance: 1%; Packaging: Tape and Reel; Voltage Rating: 50V; Termination: SMD/SMT; Working Voltage: 50V; Number of Terminations: 2; Features: Moisture Resistant; Series: RC; Resistance Tolerance: 1%; Construction: Rectangular; Length: 1mm; Width: 0.5mm; Height: 0.32mm; Depth: 0.5mm; Lead Pitch: 0.2mm; REACH SVHC: No SVHC; Lead Free: Lead Free; RoHS Compliant: Yes; Military Standard: Not; ComponentLink1URL: https://datasheet.ciiva.com/7660/38568-7660787.pdf?src-supplier=Element14; ComponentLink1Description: https://datasheet.ciiva.com/7660/38568-7660787.pdf?src-supplier=Element14; ComponentLink2URL: https://datasheet.ciiva.com/7849/1686128-7849814.pdf?src-supplier=Element14; ComponentLink2Description: https://datasheet.ciiva.com/7849/1686128-7849814.pdf?src-supplier=Element14; ComponentLink3URL: https://datasheet.ciiva.com/7983/1018594-7983486.pdf?src-supplier=Element14; ComponentLink3Description: https://datasheet.ciiva.com/7983/1018594-7983486.pdf?src-supplier=Element14; ComponentLink4URL: https://datasheet.ciiva.com/22747/1018594-22747512.pdf?src-supplier=Element14; ComponentLink4Description: https://datasheet.ciiva.com/22747/1018594-22747512.pdf?src-supplier=Element14; ComponentLink5URL: https://datasheet.ciiva.com/12667/pyu-rc0402-51-rohs-l-6-r-12667067.pdf?src-supplier=Mouser; ComponentLink5Description: https://datasheet.ciiva.com/12667/pyu-rc0402-51-rohs-l-6-r-12667067.pdf?src-supplier=Mouser; ComponentLink6URL: https://datasheet.ciiva.com/7849/1784430-7849813.pdf?src-supplier=Element14; ComponentLink6Description: https://datasheet.ciiva.com/7849/1784430-7849813.pdf?src-supplier=Element14; ComponentLink7URL: https://datasheet.ciiva.com/7849/1784430-7849815.pdf?src-supplier=Element14; ComponentLink7Description: https://datasheet.ciiva.com/7849/1784430-7849815.pdf?src-supplier=Element14; Supplier Part Number 1: 603-RC0402FR-0710KL; LCSC Part Number: C60490
R89 R90 = RC0402FR-07120RL: RES 120 OHM 1% 1/16W 0402; Manufacturer: Yageo; Item Type: Resistors; Power Rating: 62.5mW; Voltage Rating: 50V; Temperature Coefficient: 100ppm/°C; Max Power Dissipation: 63mW; Supplier: Future Electronics; Supplier Part Number: 4529079; Manufacturer Part Number: RC0402FR-07120RL; RoHS: Yes; Stock: 150000; Pricing: 10000=0.0012, 100000=0.0011, 300000=0.001, 750000=0.001, 2000000=0.0009 (USD); Case/Package: 0402; Case Code (Imperial): 0402; Case Code (Metric): 1005; Min Operating Temperature: -55°C; Max Operating Temperature: 155°C; Package Quantity: 1; Value: 120R; Tolerance: 1%; Packaging: Tape and Reel; Termination: SMD/SMT; Resistor Type: Thick Film; Number of Terminations: 2; Features: Moisture Resistant; Series: RC; Resistance Tolerance: 1%; Construction: Rectangular; Technology: THICK FILM; Voltage Rating (AC): 50V; Length: 0.039inch; Width: 0.02inch; Height: 0.016inch; Depth: 0.5mm; Reach SVHC Compliant: No; Military Standard: Not; RoHS Compliant: Yes; Lead Free: 5697LeadFree; ComponentLink1URL: https://datasheet.ciiva.com/12667/pyu-rc0402-51-rohs-l-6-r-12667958.pdf?src-supplier=Mouser; ComponentLink1Description: https://datasheet.ciiva.com/12667/pyu-rc0402-51-rohs-l-6-r-12667958.pdf?src-supplier=Mouser; ComponentLink2URL: https://datasheet.ciiva.com/7849/1018594-7849831.pdf?src-supplier=Element14; ComponentLink2Description: https://datasheet.ciiva.com/7849/1018594-7849831.pdf?src-supplier=Element14; LCSC Part Number: C114758
R91 R92 = RC0402FR-0733RL: RES 33 OHM 1% 1/16W 0402; Manufacturer: Yageo; Power Rating: 62.5mW; Voltage Rating: 50V; Temperature Coefficient: 100ppm/°C; Max Power Dissipation: 63mW; Supplier 1: Mouser; Manufacturer Part Number: RC0402FR-0733RL; RoHS: Yes; Category: Chip SMD Resistors; Stock 1: 1843488; Pricing 1: 1=0.10000, 10=0.01200, 50=0.01200, 100=0.00500, 1000=0.00300, 10000=0.00100 (USD); Case/Package: 0402; Number of Pins: 2; Case Code (Imperial): 0402; Case Code (Metric): 1005; Size Code: 0402; Min Operating Temperature: -55°C; Max Operating Temperature: 155°C; Resistor Type: Thick Film; Resistance: 33R; Tolerance: 1%; Packaging: Tape and Reel; Voltage Rating (DC): 50V; Package Quantity: 10000; Termination: SMD/SMT; Features: Moisture Resistant; Series: RC; Number of Terminations: 2; Resistance Tolerance: 1%; Construction: Rectangular; Technology: THICK FILM; Length: 1mm; Width: 0.5mm; Height: 0.35mm; Depth: 0.5mm; RoHS Compliant: Yes; REACH SVHC: Unknown; Military Standard: Not; Lead Free: Lead Free; ComponentLink1URL: https://datasheet.ciiva.com/11819/0900766b80c66297-11819487.pdf?src-supplier=RSComponents; ComponentLink1Description: https://datasheet.ciiva.com/11819/0900766b80c66297-11819487.pdf?src-supplier=RSComponents; ComponentLink2URL: https://datasheet.ciiva.com/24070/pyu-rc0402-51-rohs-l-6-r-8721-24070077.pdf?src-supplier=Mouser; ComponentLink2Description: https://datasheet.ciiva.com/24070/pyu-rc0402-51-rohs-l-6-r-8721-24070077.pdf?src-supplier=Mouser; ComponentLink3URL: https://datasheet.ciiva.com/7849/1018594-7849967.pdf?src-supplier=Element14; ComponentLink3Description: https://datasheet.ciiva.com/7849/1018594-7849967.pdf?src-supplier=Element14; ComponentLink4URL: https://datasheet.ciiva.com/7849/1018594-7849966.pdf?src-supplier=Element14; ComponentLink4Description: https://datasheet.ciiva.com/7849/1018594-7849966.pdf?src-supplier=Element14; ComponentLink5URL: https://datasheet.ciiva.com/15189/getdatasheetpartid-329253-15189431.pdf?src-supplier=Verical; ComponentLink5Description: https://datasheet.ciiva.com/15189/getdatasheetpartid-329253-15189431.pdf?src-supplier=Verical; ComponentLink6URL: https://datasheet.ciiva.com/17070/pyu-rc0402-51-rohs-l-6-r-17070335.pdf?src-supplier=Future+Electronics; ComponentLink6Description: https://datasheet.ciiva.com/17070/pyu-rc0402-51-rohs-l-6-r-17070335.pdf?src-supplier=Future+Electronics; Supplier Part Number 1: 603-RC0402FR-0733RL; LCSC Part Number: C138002
R94 R95 = RC0402FR-070RL: RES 0 OHM JUMPER 1/16W 0402; Manufacturer: Yageo; Item Type: Resistors; Tolerance: 1%; Power Rating: 62.5mW; Voltage Rating: 50V; Temperature Coefficient: 200ppm/°C; Max Power Dissipation: 63mW; Supplier 1: Mouser; Manufacturer Part Number: RC0402FR-070RL; RoHS: Yes; Stock 1: 8556842; Pricing 1: 1=0.10000, 10=0.01400, 50=0.01400, 100=0.00600, 1000=0.00300, 5000=0.00200, 10000=0.00100 (USD); Mount: Surface Mount; Case/Package: 0402; Contact Plating: Tin,Matte; Case Code (Imperial): 0402; Case Code (Metric): 1005; Size Code: 0402; Min Operating Temperature: -55°C; Max Operating Temperature: 155°C; Resistance: 0R; Resistor Type: Thick Film; Packaging: Tape and Reel; Termination: SMD/SMT; Features: Moisture Resistant; Series: RC; Number of Terminations: 2; Length: 1mm; Width: 0.5mm; Height: 0.35mm; Radiation Hardening: No; Lead Free: Lead Free; RoHS Compliant: Yes; ComponentLink1URL: https://datasheet.ciiva.com/8896/pyu-rc0402-51-rohs-l-6-8896149.pdf?src-supplier=Avnet; ComponentLink1Description: https://datasheet.ciiva.com/8896/pyu-rc0402-51-rohs-l-6-8896149.pdf?src-supplier=Avnet; ComponentLink2URL: https://datasheet.ciiva.com/16790/pyu-rc0402-51-rohs-l-6-r-16790444.pdf?src-supplier=Future+Electronics; ComponentLink2Description: https://datasheet.ciiva.com/16790/pyu-rc0402-51-rohs-l-6-r-16790444.pdf?src-supplier=Future+Electronics; Supplier Part Number 1: 603-RC0402FR-070RL; LCSC Part Number: C106231
R96 = AF0402JR-071ML: RES SMD 1M OHM 5% 1/16W 0402; Manufacturer: Yageo; Resistance: 1MR; Max Power Dissipation: 63mW; Temperature Coefficient: 100ppm/°C; Item Type: Resistor; Supplier 1: Digi-Key; Manufacturer Part Number: AF0402JR-071ML; Stock 1: 0; Pricing 1: 10000=0.00408 (USD); Case/Package: 0402; Min Operating Temperature: -55°C; Max Operating Temperature: 155°C; Packaging: Tape and Reel; Resistor Type: Thick Film; Number of Terminations: 2; Tolerance: 5%; Features: Moisture Resistant,Anti-Sulfur; Length: 0.039inch; Width: 0.02inch; Height: 0.015inch; RoHS Compliant: Yes; ComponentLink1URL: https://www.yageo.com/upload/media/product/productsearch/datasheet/rchip/PYu-AF_51_RoHS_L_6.pdf?src-supplier=Digi-Key; ComponentLink1Description: https://www.yageo.com/upload/media/product/productsearch/datasheet/rchip/PYu-AF_51_RoHS_L_6.pdf?src-supplier=Digi-Key; Supplier Part Number 1: AF0402JR-071ML-ND; LCSC Part Number: C144054
R97 R98 = RC0402FR-075K1L: RES 5.1K OHM 1% 1/16W 0402; Manufacturer: Yageo; Power Rating: 63mW; Resistance: 5.1kR; Temperature Coefficient: 100ppm/°C; Voltage Rating: 50V; Item Type: Resistor; Supplier 1: Avnet; Manufacturer Part Number: RC0402FR-075K1L; RoHS: Yes; Category: Chip SMD Resistors; Stock 1: 65000; Pricing 1: 10000=0.00085 (USD); Case/Package: 0402; Case Code (Metric): 1005; Case Code (Imperial): 0402; Min Operating Temperature: -55°C; Max Operating Temperature: 155°C; Tolerance: 1%; Technology: THICK FILM; Packaging: Tape and Reel; Package Quantity: 1; Resistor Type: Thick Film; Number of Terminations: 2; Termination: SMD/SMT; Max Power Dissipation: 63mW; Voltage Rating (DC): 50V; Working Voltage: 50V; Features: Moisture Resistant; Series: RC; Resistance Tolerance: 1%; Construction: Rectangular; Length: 1mm; Width: 0.02inch; Height: 0.016inch; Depth: 0.5mm; RoHS Compliant: Yes; Military Standard: Not; Lead Free: Lead Free; ComponentLink1URL: https://datasheet.ciiva.com/7983/1018594-7983519.pdf?src-supplier=Element14; ComponentLink1Description: https://datasheet.ciiva.com/7983/1018594-7983519.pdf?src-supplier=Element14; ComponentLink2URL: https://datasheet.ciiva.com/46394/1018594-46394936.pdf?src-supplier=Element14; ComponentLink2Description: https://datasheet.ciiva.com/46394/1018594-46394936.pdf?src-supplier=Element14; ComponentLink3URL: https://datasheet.ciiva.com/2453/pyu-r-int-thick-7-2453401.pdf?src-supplier=Digi-Key; ComponentLink3Description: https://datasheet.ciiva.com/2453/pyu-r-int-thick-7-2453401.pdf?src-supplier=Digi-Key; ComponentLink4URL: https://datasheet.ciiva.com/2453/pyu-r-int-thick-7-2453402.pdf?src-supplier=Digi-Key; ComponentLink4Description: https://datasheet.ciiva.com/2453/pyu-r-int-thick-7-2453402.pdf?src-supplier=Digi-Key; ComponentLink5URL: https://datasheet.ciiva.com/2453/pyu-r-int-thick-7-2453400.pdf?src-supplier=Digi-Key; ComponentLink5Description: https://datasheet.ciiva.com/2453/pyu-r-int-thick-7-2453400.pdf?src-supplier=Digi-Key; ComponentLink6URL: https://datasheet.ciiva.com/12558/pyu-rc0402-51-rohs-l-6-r-8721-12558460.pdf?src-supplier=Mouser; ComponentLink6Description: https://datasheet.ciiva.com/12558/pyu-rc0402-51-rohs-l-6-r-8721-12558460.pdf?src-supplier=Mouser; ComponentLink7URL: https://datasheet.ciiva.com/16744/pyu-rc0402-51-rohs-l-6-r-16744283.pdf?src-supplier=Future+Electronics; ComponentLink7Description: https://datasheet.ciiva.com/16744/pyu-rc0402-51-rohs-l-6-r-16744283.pdf?src-supplier=Future+Electronics; ComponentLink8URL: https://datasheet.ciiva.com/15189/getdatasheetpartid-323636-15189493.pdf?src-supplier=Verical; ComponentLink8Description: https://datasheet.ciiva.com/15189/getdatasheetpartid-323636-15189493.pdf?src-supplier=Verical; Supplier Part Number 1: RC0402FR-075K1L; LCSC Part Number: C105872
R99 = RC0402FR-070RL: RES 0 OHM JUMPER 1/16W 0402; Manufacturer: Yageo; Item Type: Resistors; Resistance: 0R; Tolerance: 1%; Power Rating: 62.5mW; Voltage Rating: 50V; Temperature Coefficient: 200ppm/°C; Max Power Dissipation: 63mW; Supplier 1: Mouser; Manufacturer Part Number: RC0402FR-070RL; RoHS: Yes; Stock 1: 8556842; Pricing 1: 1=0.10000, 10=0.01400, 50=0.01400, 100=0.00600, 1000=0.00300, 5000=0.00200, 10000=0.00100 (USD); Mount: Surface Mount; Case/Package: 0402; Contact Plating: Tin,Matte; Case Code (Imperial): 0402; Case Code (Metric): 1005; Size Code: 0402; Min Operating Temperature: -55°C; Max Operating Temperature: 155°C; Resistor Type: Thick Film; Packaging: Tape and Reel; Termination: SMD/SMT; Features: Moisture Resistant; Series: RC; Number of Terminations: 2; Length: 1mm; Width: 0.5mm; Height: 0.35mm; Radiation Hardening: No; Lead Free: Lead Free; RoHS Compliant: Yes; ComponentLink1URL: https://datasheet.ciiva.com/8896/pyu-rc0402-51-rohs-l-6-8896149.pdf?src-supplier=Avnet; ComponentLink1Description: https://datasheet.ciiva.com/8896/pyu-rc0402-51-rohs-l-6-8896149.pdf?src-supplier=Avnet; ComponentLink2URL: https://datasheet.ciiva.com/16790/pyu-rc0402-51-rohs-l-6-r-16790444.pdf?src-supplier=Future+Electronics; ComponentLink2Description: https://datasheet.ciiva.com/16790/pyu-rc0402-51-rohs-l-6-r-16790444.pdf?src-supplier=Future+Electronics; Supplier Part Number 1: 603-RC0402FR-070RL; LCSC Part Number: C106231
SW3 = B3U-1000P: SWITCH TACTILE SPST-NO 0.05A 12V; Manufacturer: Omron; Mechanical Life: 200000Cycles; Operating Force: 1.5N; Throw Configuration: SPST; Current Rating: 50mA; Contact Resistance: 100mR; Illumination Type: Non-Illuminated,Illuminated; Switch Travel: 0.15mm; Switch Function: Off-Mom; Actuator Type: Standard; Actuator Length: 0.4mm; Ratings: Dust Proof,IP40; ComponentLink1URL: http://www.farnell.com/datasheets/60838.pdf?src-supplier=Farnell; ComponentLink1Description: http://www.farnell.com/datasheets/60838.pdf?src-supplier=Farnell; ComponentLink2URL: http://www.farnell.com/datasheets/60838.pdf?src-supplier=Element14; ComponentLink2Description: http://www.farnell.com/datasheets/60838.pdf?src-supplier=Element14; ComponentLink3URL: https://omronfs.omron.com/en_US/ecb/products/pdf/en-b3u.pdf?src-supplier=Digi-Key; ComponentLink3Description: https://omronfs.omron.com/en_US/ecb/products/pdf/en-b3u.pdf?src-supplier=Digi-Key; ComponentLink4URL: http://www.omron.com/ecb/products/pdf/en-b3u.pdf?src-supplier=Digi-Key; ComponentLink4Description: http://www.omron.com/ecb/products/pdf/en-b3u.pdf?src-supplier=Digi-Key; ComponentLink5URL: https://www.distrelec.biz/Web/Downloads/he/et/B3U_eng_datasheet.pdf?mime=application%2Fpdf&src-supplier=Distrelec; ComponentLink5Description: https://www.distrelec.biz/Web/Downloads/he/et/B3U_eng_datasheet.pdf?mime=application%2Fpdf&src-supplier=Distrelec; ComponentLink6URL: http://www.onlinecomponents.com/productFiles/mf-OM/en-b3u.pdf?src-supplier=Onlinecomponents.com; ComponentLink6Description: http://www.onlinecomponents.com/productFiles/mf-OM/en-b3u.pdf?src-supplier=Onlinecomponents.com; Supplier 1: Digi-Key; Manufacturer Part Number: B3U-1000P; Stock 1: 116454; Pricing 1: 1=1, 10=0.961, 25=0.9064, 50=0.7976, 100=0.7251, 250=0.68888, 500=0.67074, 1000=0.52571 (USD); Mount: Surface Mount; Weight: 0.000776oz; Contact Material: Silver; Min Operating Temperature: -25°C; Max Operating Temperature: 70°C; Packaging: Tape and Reel; Voltage Rating (DC): 12V; Package Quantity: 1; Max Current Rating: 50mA; Termination: SMD/SMT; Orientation: Straight; Max Voltage Rating (DC): 12V; Electrical Life: 200000Cycles; Insulation Resistance: 100MR; Contact Current Rating: 50mA; Length: 4mm; Height: 1.2mm; Depth: 2.5mm; Width: 3mm; REACH SVHC: Unknown; Lead Free: Lead Free; ComponentLink7URL: https://www.verical.com/server-webapp/html/getDatasheet?partID=552554&src-supplier=Verical; ComponentLink7Description: https://www.verical.com/server-webapp/html/getDatasheet?partID=552554&src-supplier=Verical; ComponentLink8URL: http://www.farnell.com/datasheets/1685550.pdf?src-supplier=Element14; ComponentLink8Description: http://www.farnell.com/datasheets/1685550.pdf?src-supplier=Element14; ComponentLink9URL: http://www.farnell.com/datasheets/2610940.pdf?src-supplier=Farnell; ComponentLink9Description: http://www.farnell.com/datasheets/2610940.pdf?src-supplier=Farnell; ComponentLink10URL: https://www.alliedelec.com/m/d/4c8a9ef82804fc3c241a13c1e298fd73.pdf?src-supplier=Allied+Electronics; ComponentLink10Description: https://www.alliedelec.com/m/d/4c8a9ef82804fc3c241a13c1e298fd73.pdf?src-supplier=Allied+Electronics; Supplier Part Number 1: SW1020DKR-ND; LCSC Part Number: C231329; Item Type: Switch
TP5 TP6 = TEST POINT 0.5mm Dia: Test Point ON; Item Type: Test Point; Manufacturer Part Number: TEST POINT 0.5mm Dia
U13 = STM32F446VET6: IC MCU 32BIT 512KB FLASH 100LQFP; Manufacturer: STMicroelectronics; Manufacturer Part Number: STM32F446VET6; Package: LQFP (14x14); LCSC Part Number: C91929; Item Type: IC
X3 = 5TJ480000XYLBC: 8MHz 18pF ±10ppm SMD5032-4P Crystals ROHS; Manufacturer: JYJE; Manufacturer Part Number: 5TJ480000XYLBC; ComponentLink1Description: LCSC; ComponentLink1URL: https://www.lcsc.com/product-detail/Crystals_JYJE-5TJ480000XYLBC_C2149247.html; Package: SMD5032-4P; LCSC Part Number: C2149247; Item Type: Crystal

## Sheet Motor_Driver_Sheet1.SchDoc
size 420 x 297 mm; SheetNumber: 9; SheetTotal: 26
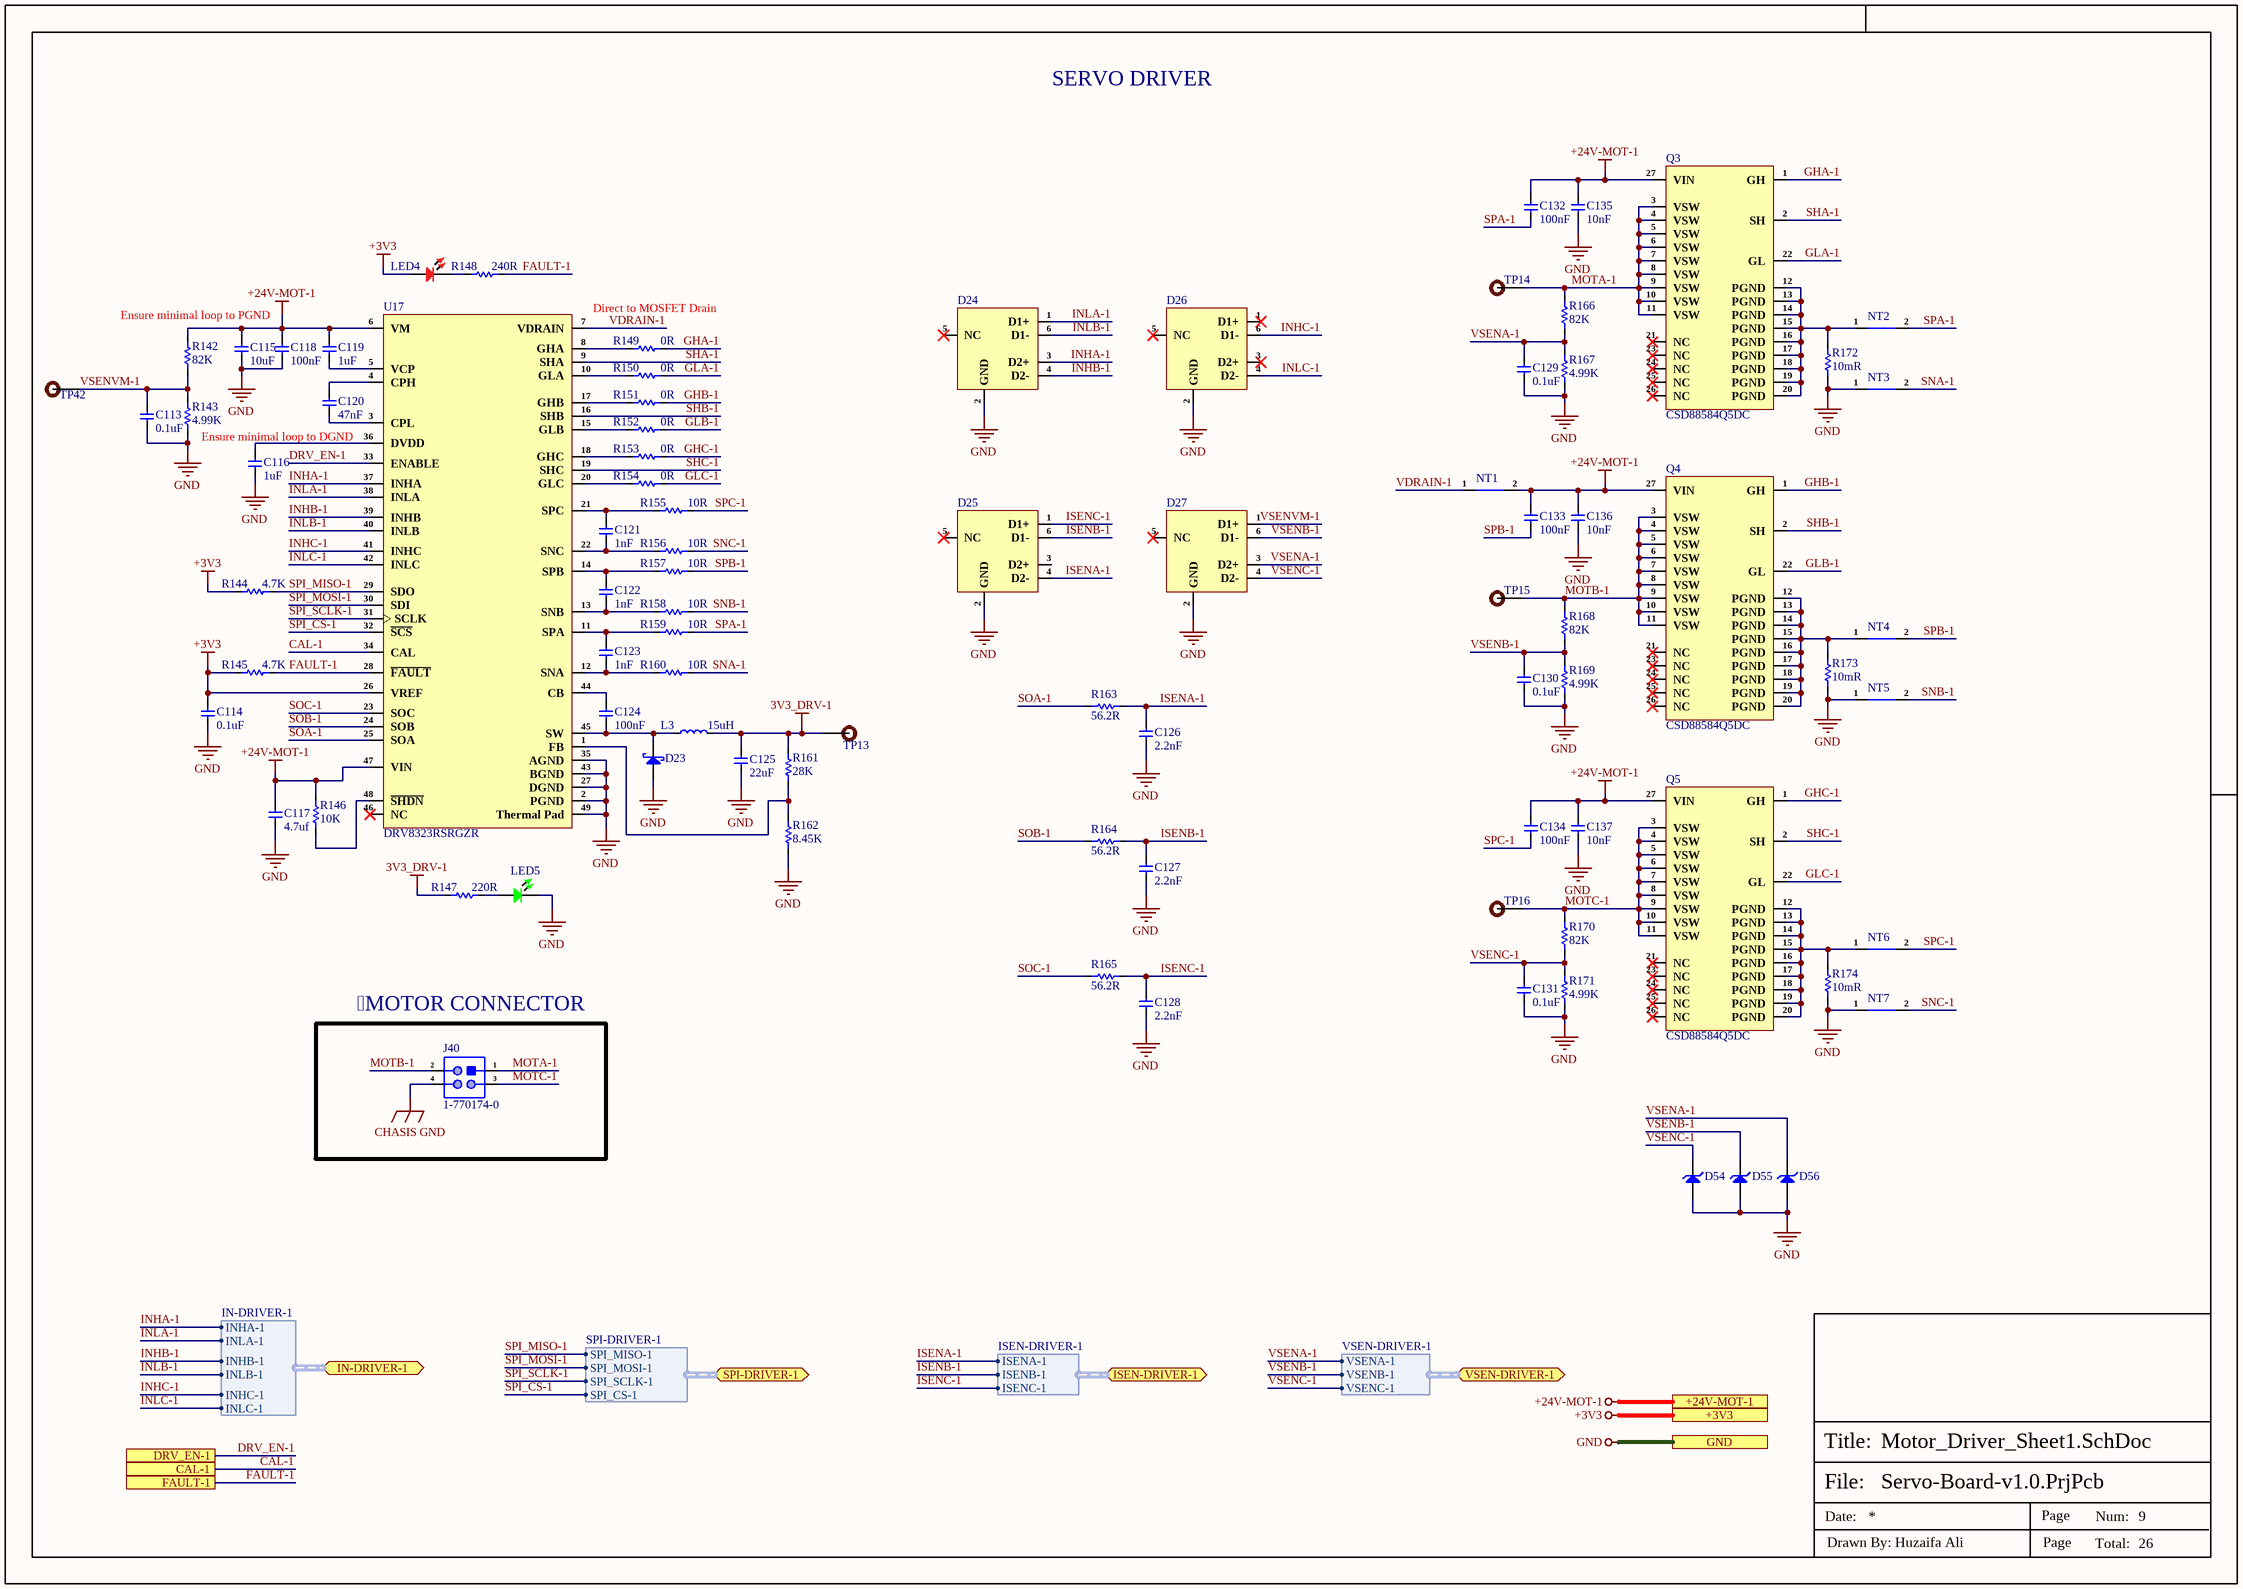
[diagram p18: Motor_Driver_Sheet1.SchDoc]

### Parts
C113  0.1uF  [Cap-0402]
C114  0.1uF  [Cap-0402]
C115  10uF  [Cap-1206]
C116  1uF  [Cap-0603]
C117  4.7uf  [Cap-0805]
C118  100nF  [Cap-0603]
C119  1uF  [Cap-0603]
C120  47nF  [Cap-0402]
C121  1nF  [Cap-0402]
C122  1nF  [Cap-0402]
C123  1nF  [Cap-0402]
C124  100nF  [Cap-0603]
C125  22uF  [Cap-0603]
C126  2.2nF  [Cap-0603]
C127  2.2nF  [Cap-0603]
C128  2.2nF  [Cap-0603]
C129  0.1uF  [Cap-0402]
C130  0.1uF  [Cap-0402]
C131  0.1uF  [Cap-0402]
C132  100nF  [Cap-0603]
C133  100nF  [Cap-0603]
C134  100nF  [Cap-0603]
C135  10nF  [Cap-0402]
C136  10nF  [Cap-0402]
C137  10nF  [Cap-0402]
D23  SS24A  [SMA]  (value not drawn)
D24  TPD4E1U06DCKR  [SOT-363]  (value not drawn)
D25  TPD4E1U06DCKR  [SOT-363]  (value not drawn)
D26  TPD4E1U06DCKR  [SOT-363]  (value not drawn)
D27  TPD4E1U06DCKR  [SOT-363]  (value not drawn)
D54  MM3Z3V3B  [SOD323F]  (value not drawn)
D55  MM3Z3V3B  [SOD323F]  (value not drawn)
D56  MM3Z3V3B  [SOD323F]  (value not drawn)
J40  1-770174-0  [1-770174-0]
L3  15uH  [FEXL0550A-150M]
LED4  RED  [LED-0603]  (value not drawn)
LED5  Emerald  [LED-0603]  (value not drawn)
NT1  Net Tie_SMD  [Net Tie Pad]  (value not drawn)  (net tie, no BOM)
NT2  Net Tie_SMD  [Net Tie Pad]  (value not drawn)  (net tie, no BOM)
NT3  Net Tie_SMD  [Net Tie Pad]  (value not drawn)  (net tie, no BOM)
NT4  Net Tie_SMD  [Net Tie Pad]  (value not drawn)  (net tie, no BOM)
NT5  Net Tie_SMD  [Net Tie Pad]  (value not drawn)  (net tie, no BOM)
NT6  Net Tie_SMD  [Net Tie Pad]  (value not drawn)  (net tie, no BOM)
NT7  Net Tie_SMD  [Net Tie Pad]  (value not drawn)  (net tie, no BOM)
Q3  CSD88584Q5DC  [22-VSON-CLIP (5x6)]
Q4  CSD88584Q5DC  [22-VSON-CLIP (5x6)]
Q5  CSD88584Q5DC  [22-VSON-CLIP (5x6)]
R142  82K  [Res-0603]
R143  4.99K  [Res-0603]
R144  4.7K  [Res-0402]
R145  4.7K  [Res-0402]
R146  10K  [Res-0402]
R147  220R  [Res-0603]
R148  240R  [Res-0402]
R149  0R  [Res-0402]
R150  0R  [Res-0402]
R151  0R  [Res-0402]
R152  0R  [Res-0402]
R153  0R  [Res-0402]
R154  0R  [Res-0402]
R155  10R  [Res-0603]
R156  10R  [Res-0603]
R157  10R  [Res-0603]
R158  10R  [Res-0603]
R159  10R  [Res-0603]
R160  10R  [Res-0603]
R161  28K  [Res-0402]
R162  8.45K  [Res-0402]
R163  56.2R  [Res-0603]
R164  56.2R  [Res-0603]
R165  56.2R  [Res-0603]
R166  82K  [Res-0603]
R167  4.99K  [Res-0603]
R168  82K  [Res-0603]
R169  4.99K  [Res-0603]
R170  82K  [Res-0603]
R171  4.99K  [Res-0603]
R172  10mR  [RES-2512]
R173  10mR  [RES-2512]
R174  10mR  [RES-2512]
TP13  TEST POINT 0.5mm Dia  [Test-point - 0.5mm]  (value not drawn)  (no BOM)
TP14  TEST POINT 0.5mm Dia  [Test-point - 0.5mm]  (value not drawn)  (no BOM)
TP15  TEST POINT 0.5mm Dia  [Test-point - 0.5mm]  (value not drawn)  (no BOM)
TP16  TEST POINT 0.5mm Dia  [Test-point - 0.5mm]  (value not drawn)  (no BOM)
TP42  TEST POINT 0.5mm Dia  [Test-point - 0.5mm]  (value not drawn)  (no BOM)
U17  DRV8323RSRGZR  [48-VQFN (7x7)]

### Ports
+3V3 (see Servo1[2A], CAN_Sheet[4D], Controller_Sheet[5D], DIO_1[5D], DIO_2[5D], DIO_3[5D], DIO_4[5D], Encoder_Sheet1[5D], Encoder_Sheet2[4D], Encoder_Sheet3[4D], Encoder_Sheet4[5D], EtherCAT_Sheet[5D], Motor_Driver_Sheet2[5D], Motor_Driver_Sheet3[5D], Motor_Driver_Sheet4[5D], Power_Sheet[5D], RS485_RS232_Sheet[5D], Sec_Controller_Sheet1[5D], Sec_Controller_Sheet2[5D], Sec_Controller_Sheet3[5D], Sec_Controller_Sheet4[5D], Servo1[5D], Servo2[5D], Servo3[5D], Servo4[5D]), +24V-MOT-1 (see Servo1[2A], Power_Sheet[5D], Servo1[5D]), CAL-1 (see Servo1[2B], Sec_Controller_Sheet1[2D]), DRV_EN-1 (see Servo1[2B], Sec_Controller_Sheet1[2D]), FAULT-1 (see Servo1[2B], Sec_Controller_Sheet1[2D]), GND (see Servo1[2B], CAN_Sheet[4D], Controller_Sheet[5D], DIO_1[5D], DIO_2[5D], DIO_3[5D], DIO_4[5D], Encoder_Sheet1[5D], Encoder_Sheet2[4D], Encoder_Sheet3[4D], Encoder_Sheet4[5D], EtherCAT_Sheet[5D], Motor_Driver_Sheet2[5D], Motor_Driver_Sheet3[5D], Motor_Driver_Sheet4[5D], Power_Sheet[5D], RS485_RS232_Sheet[5D], Sec_Controller_Sheet1[5D], Sec_Controller_Sheet2[5D], Sec_Controller_Sheet3[5D], Sec_Controller_Sheet4[5D], Servo1[5D], Servo2[5D], Servo3[5D], Servo4[5D]), IN-DRIVER-1 (bidir, harness IN-DRIVER-1, see Servo1[2B], Sec_Controller_Sheet1[2D]), ISEN-DRIVER-1 (bidir, harness ISEN-DRIVER-1, see Servo1[2B], Sec_Controller_Sheet1[2D]), SPI-DRIVER-1 (bidir, harness SPI-DRIVER-1, see Servo1[2B], Sec_Controller_Sheet1[2D]), VSEN-DRIVER-1 (bidir, harness VSEN-DRIVER-1, see Servo1[2B], Sec_Controller_Sheet1[3C])

### Harnesses
IN-DRIVER-1: INHA-1, INLA-1, INHB-1, INLB-1, INHC-1, INLC-1
SPI-DRIVER-1: SPI_MISO-1, SPI_MOSI-1, SPI_SCLK-1, SPI_CS-1
ISEN-DRIVER-1: ISENA-1, ISENB-1, ISENC-1
VSEN-DRIVER-1: VSENA-1, VSENB-1, VSENC-1